# Altium schematic sheet Sheet.SchDoc
size A; SheetNumber: 2; SheetTotal: 4
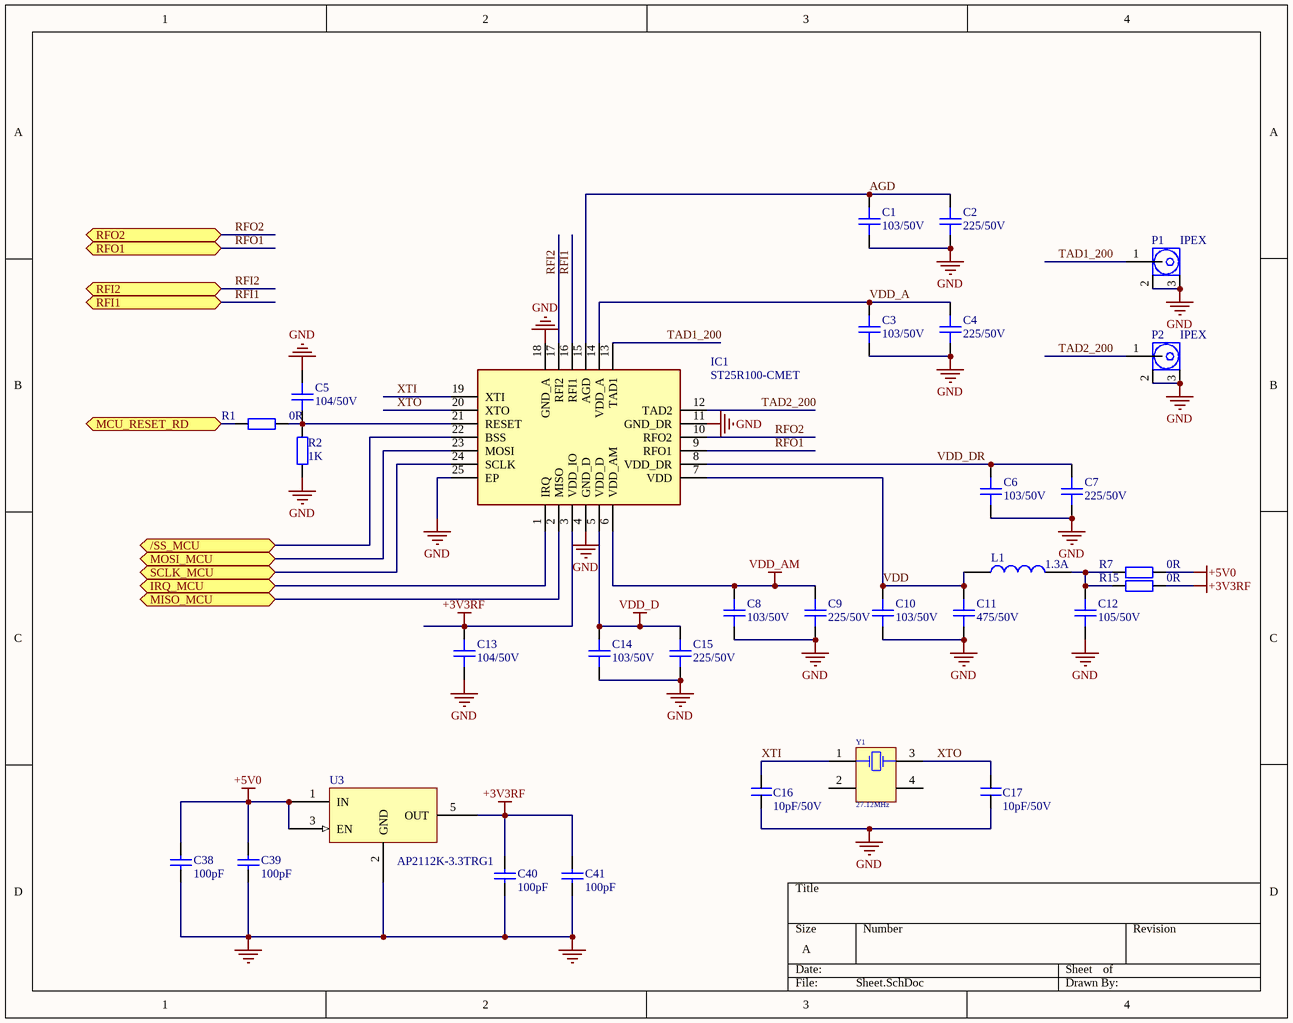
[diagram p0: Sheet.SchDoc]

## Parts
C1  103/50V  [CAP_CERAMIC_0603(1608mm)]
C2  225/50V  [CAP_CERAMIC_0603(1608mm)]
C3  103/50V  [CAP_CERAMIC_0603(1608mm)]
C4  225/50V  [CAP_CERAMIC_0603(1608mm)]
C5  104/50V  [CAP_CERAMIC_0603(1608mm)]
C6  103/50V  [CAP_CERAMIC_0603(1608mm)]
C7  225/50V  [CAP_CERAMIC_0603(1608mm)]
C8  103/50V  [CAP_CERAMIC_0603(1608mm)]
C9  225/50V  [CAP_CERAMIC_0603(1608mm)]
C10  103/50V  [CAP_CERAMIC_0603(1608mm)]
C11  475/50V  [CAP_CERAMIC_0603(1608mm)]
C12  105/50V  [CAP_CERAMIC_0603(1608mm)]
C13  104/50V  [CAP_CERAMIC_0603(1608mm)]
C14  103/50V  [CAP_CERAMIC_0603(1608mm)]
C15  225/50V  [CAP_CERAMIC_0603(1608mm)]
C16  10pF/50V  [CAP_CERAMIC_0603(1608mm)]
C17  10pF/50V  [CAP_CERAMIC_0603(1608mm)]
C38  value 100pF  [CAP_CERAMIC_0603(1608mm)]  (hidden comment: Capacitor)
C39  value 100pF  [CAP_CERAMIC_0603(1608mm)]  (hidden comment: Capacitor)
C40  value 100pF  [CAP_CERAMIC_0603(1608mm)]  (hidden comment: Capacitor)
C41  value 100pF  [CAP_CERAMIC_0603(1608mm)]  (hidden comment: Capacitor)
IC1  ST25R100-CMET  [QFN50P400X400X60-25N-D]
L1  1.3A  [FEB_0603(1608)]
P1  IPEX  [SMA-ANT]
P2  IPEX  [SMA-ANT]
R1  0R  [RES_0603(1608)]
R2  1K  [RES_0603(1608)]
R7  0R  [RES_0603(1608)]
R15  0R  [RES_0603(1608)]
U3  AP2112K-3.3TRG1  [SOT23-5]
Y1  value 27.12MHz  [TSX-3225]  (hidden comment: Quartz Crystal   4-Pin TSX-3225   27.12MHz)

## Ports
/SS_MCU (bidir, see STM32C0_ST25R100_EVK[2B], MCU[3B]), IRQ_MCU (bidir, see STM32C0_ST25R100_EVK[2B], MCU[3B]), MCU_RESET_RD (bidir, see STM32C0_ST25R100_EVK[2B], MCU[3B]), MISO_MCU (bidir, see STM32C0_ST25R100_EVK[2B], MCU[3B]), MOSI_MCU (bidir, see STM32C0_ST25R100_EVK[2B], MCU[3B]), RFI1 (bidir, see STM32C0_ST25R100_EVK[3B], RFID_ANT[1B]), RFI2 (bidir, see STM32C0_ST25R100_EVK[3B], RFID_ANT[1A]), RFO1 (bidir, see STM32C0_ST25R100_EVK[3B], RFID_ANT[1B]), RFO2 (bidir, see STM32C0_ST25R100_EVK[3B], RFID_ANT[1B]), SCLK_MCU (bidir, see STM32C0_ST25R100_EVK[2B], MCU[3B])

## Nets
+3V3RF: C13.2 C40.2 C41.2 IC1.3(VDD_IO) R15.2 U3.5(OUT)
+5V0: C38.2 C39.2 R7.2 U3.1(IN) U3.3(EN)
GND: C1.1 C2.1 C3.1 C4.1 C5.2 C6.1 C7.1 C8.1 C9.1 C10.1 C11.1 C12.1 C13.1 C14.1 C15.1 C16.2 C17.2 C38.1 C39.1 C40.1 C41.1 IC1.4(GND_D) IC1.11(GND_DR) IC1.18(GND_A) IC1.25(EP) P1.2 P1.3 P2.2 P2.3 R2.1 U3.2(GND)
VDD_AM: C8.2 C9.2 IC1.6(VDD_AM)
VDD_D: C14.2 C15.2 IC1.5(VDD_D)
/SS_MCU: IC1.22(BSS) ; port /SS_MCU
AGD: C1.2 C2.2 IC1.15(AGD)
IRQ_MCU: IC1.1(IRQ) ; port IRQ_MCU
MCU_RESET_RD: R1.1 ; port MCU_RESET_RD
MISO_MCU: IC1.2(MISO) ; port MISO_MCU
MOSI_MCU: IC1.23(MOSI) ; port MOSI_MCU
RFI1: IC1.16(RFI1) ; port RFI1
RFI2: IC1.17(RFI2) ; port RFI2
RFO1: IC1.9(RFO1) ; port RFO1
RFO2: IC1.10(RFO2) ; port RFO2
SCLK_MCU: IC1.24(SCLK) ; port SCLK_MCU
TAD1_200: IC1.13(TAD1) P1.1
TAD2_200: IC1.12(TAD2) P2.1
VDD: C10.2 C11.2 IC1.7(VDD) L1.1
VDD_A: C3.2 C4.2 IC1.14(VDD_A)
VDD_DR: C6.2 C7.2 IC1.8(VDD_DR)
XTI: C16.1 IC1.19(XTI) Y1.1(OSC1)
XTO: C17.1 IC1.20(XTO) Y1.3(OSC2)
NetC5_1: C5.1 IC1.21(RESET) R1.2 R2.2
NetC12_2: C12.2 L1.2 R7.1 R15.1

Not connected (* = marked no-connect by the designer): Y1 2(NC) 4(NC)

## Library data of the parts
C1-C15 = C0603: Capacitor Ceramic SMD 0603(1608); Value: 33p; Published: 8-Jun-2000; LatestRevisionDate: 17-Jul-2002; LatestRevisionNote: Re-released for DXP Platform.; PackageReference: RAD-0.3; Publisher: Altium Limited
C16 C17 = CC0603JRNPO9BN100: CAP CER 10PF 50V 5% COG/NPO 0603; MFR: TDK; SOLD: SMT; Package: 0603; Part Number: CC0603JRNPO9BN100
C38-C41 = MCD-00205: Capacitor, MLCC, 100pF, 50V, NPO, +/-5%, 0402, T=0.5mm; Part_Preference: Recommended; Manufacturer: YAGEO; Manufacturer_Part_Number: CC0402JRNPO9BN101; Component_Country_Of_Origin: China; ShowFields: YES; ID: 2658; Internal_Part_Number: MCD-00205; Status: Released; Part_Type: Capacitor; Package: 0402; ComponentLink1URL: http://tunmcdsvn.tun.st.com/Component_Documentation_Library/Trunk/Capacitor/YAGEO_NP0_Series; Order_Code_Digikey: 311-1024-1-ND; Order_Code_Farnell: 3019226RL; Order_Code_RS: N/A
IC1 = ST25R100-CMET: Integrated Circuit; Manufacturer_Name: STMicroelectronics; Datasheet Link: https://www.st.com/resource/en/datasheet/st25r100.pdf; Height: 0.6mm; Manufacturer_Part_Number: ST25R100-CMET; Mouser Part Number: 511-ST25R100-CMET; Mouser Price/Stock: https://www.mouser.co.uk/ProductDetail/STMicroelectronics/ST25R100-CMET?qs=HoCaDK9Nz5cyKRkjt%2FIQ%2Fw%3D%3D
L1 = IND: IND-FIXED 0603; MPN: BLM15PD121SN1D; Solder: SMT; Value: 120 Ohms @ 100 MHz
P1 P2 = LTI-IPXSM66AL: IPX/U.FL Surface Mount Mating Receptacle; CompanyID: VT-01357; Solder: SMT; Value: IPEX_GPS; MPN: LTI-IPXSM66AL
R1 R7 R15 = R0603: Resistor SMD 0603(1608); MPN: RC0603FR-070RL; Value: 0R; Package: 0603
R2 = RC0603FR-0710KL: RES SMD 10K OHM 1% 1/10W 0603; Solder: SMT; Value: 1K; MPN: RC0603FR-0710KL; Parameter 1: *
U3 = AP2112K-3.3TRG1: IC REG LDO 3.3V 0.6A SOT25; CompanyID: VT-01101; Solder: SMT; MPN: AP2112K-3.3TRG1; Value: AP2112K-3.3TRG1
Y1 = 2SMX: Quartz Crystal   4-Pin SMD 3.2x2.5 mm   27.12 MHz; Note: PCB layout complies with manufacturer's recommendation.; Published: 17-Jul-2002; DatasheetDocument: 9-Sep-1999; PackageDocument: 9-Sep-1999; PackageReference: 2SMX; Publisher: Altium Limited; ComponentLink1Description: Manufacturer Link; ComponentLink1URL: http://www.cmac.com/mt/; Type: Crystal